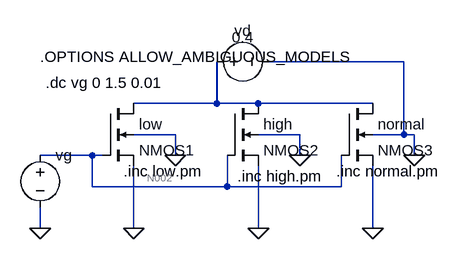
[diagram p0: schematic idvg.asc]
idvg.asc, the LTspice schematic file:
Version 4.1
SHEET 1 880 728
WIRE 448 128 240 128
WIRE 160 192 160 128
WIRE 160 192 32 192
WIRE 224 192 160 192
WIRE 400 192 224 192
WIRE 96 240 32 240
WIRE 288 240 224 240
WIRE 448 240 448 128
WIRE 448 240 400 240
WIRE 464 240 448 240
WIRE -32 272 -112 272
WIRE -16 272 -32 272
WIRE 96 272 96 240
WIRE 288 272 288 240
WIRE 464 272 464 240
WIRE -32 320 -32 272
WIRE 176 320 176 272
WIRE 176 320 -32 320
WIRE 352 320 352 272
WIRE 352 320 176 320
WIRE -112 384 -112 352
WIRE 32 384 32 288
WIRE 224 384 224 288
WIRE 400 384 400 288
FLAG -112 384 0
FLAG 32 384 0
FLAG 96 272 0
FLAG 224 384 0
FLAG 288 272 0
FLAG 400 384 0
FLAG 464 272 0
SYMBOL nmos4 -16 192 R0
SYMATTR InstName low
SYMATTR Value2 l=65nm w=1um
SYMATTR Value NMOS1
SYMBOL voltage -112 256 R0
WINDOW 123 0 0 Left 0
WINDOW 39 0 0 Left 0
WINDOW 3 24 26 Left 2
SYMATTR Value ""
SYMATTR InstName vg
SYMBOL voltage 144 128 R270
WINDOW 0 32 56 VTop 2
WINDOW 3 22 56 VTop 2
WINDOW 123 0 0 Left 0
WINDOW 39 0 0 Left 0
SYMATTR InstName vd
SYMATTR Value 0.4
SYMBOL nmos4 176 192 R0
SYMATTR InstName high
SYMATTR Value2 l=65nm w=1um
SYMATTR Value NMOS2
SYMBOL nmos4 352 192 R0
SYMATTR InstName normal
SYMATTR Value2 l=65nm w=1um
SYMATTR Value NMOS3
TEXT 16 296 Left 2 !.inc low.pm
TEXT -112 120 Left 2 !.OPTIONS ALLOW_AMBIGUOUS_MODELS
TEXT -104 160 Left 2 !.dc vg 0 1.5 0.01
TEXT 344 296 Left 2 !.inc normal.pm
TEXT 192 304 Left 2 !.inc high.pm

The netlist it stands for:
* idvg.asc
M§low N001 N002 0 0 NMOS1 l=65nm w=1um
vg N002 0
vd N001 0 0.4
M§high N001 N002 0 0 NMOS2 l=65nm w=1um
M§normal N001 N002 0 0 NMOS3 l=65nm w=1um
.model NMOS NMOS
.model PMOS PMOS
.lib standard.mos
.inc low.pm
.OPTIONS ALLOW_AMBIGUOUS_MODELS
.dc vg 0 1.5 0.01
.inc normal.pm
.inc high.pm
.backanno
.end

* Results of the author's LTspice run, read from the files saved beside the schematic
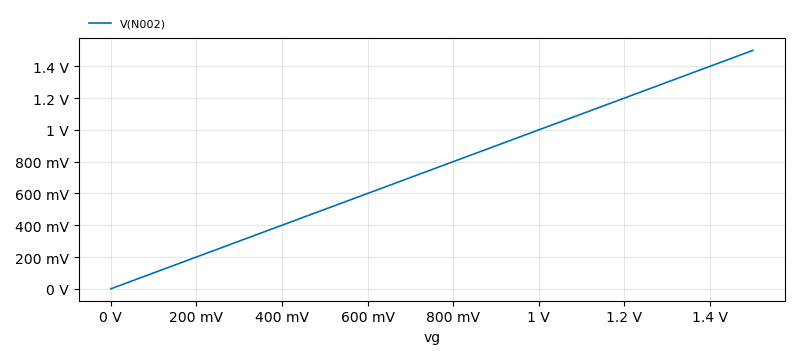
[diagram p1: DC transfer characteristic of idvg.asc, plotted from the saved traces]
* DC transfer characteristic, 1 run:
*   V(N002): 0 V at vg=0 V, 1.5 V at vg=1.5 V, min 0 V, max 1.5 V